# Altium project Sky_1.PrjPcb
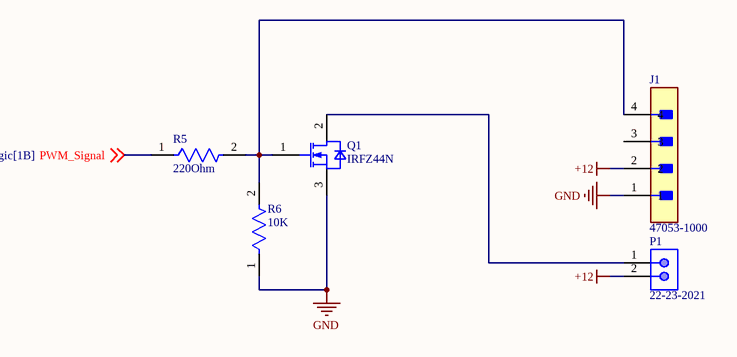
[diagram p0: PWM.SchDoc]
4 sheets, 42 parts. Net scope: flat (ports and power ports of the same name join across sheets).
Board file: PCB1.PcbDoc
Sheets:
  PWM.SchDoc
  Power.SchDoc
  Logic.SchDoc
  Ports_and_pins.SchDoc

## Sheet PWM.SchDoc
size A4; SheetNumber: 1; SheetTotal: 4

### Parts
J1  47053-1000  [FP-470531000-MFG]
P1  22-23-2021  [MOLX-22-23-2021_V]
Q1  IRFZ44N  [TO220]
R5  220Ohm  [FP-CRGCQ1206-IPC_C]
R6  10K  [FP-CRGCQ1206-IPC_C]

### Nets
+12: J1.2 P1.2
GND: J1.1 Q1.3(SOURCE) R6.1
PWM_Signal: R5.1 ; off-sheet PWM_Signal
NetJ1_4: J1.4 Q1.1(GATE) R5.2 R6.2
NetP1_1: P1.1 Q1.2(DRAIN)

Not connected (* = marked no-connect by the designer): J1 3

### Library data of the parts
J1 = CMP-04776-000290-2: CONN HEADER VERT 4POS 2.54MM; NexarPartId: 854935; Manufacturer Lifecycle Status: ACTIVE; Voltage Rating (DC): 250V; Gender: Male; Plating: Copper; Number of Positions: 4; Glow Wire Compliant: Non-compliant; Current Rating: 500mA; Max Operating Temperature: 75°C; Number of Rows: 1; REACH SVHC: Unknown; Ambient Temperature Range High: 105°C; Pitch: 2.54mm; Height: 7.7mm; Min Operating Temperature: 0°C; Packaging: Bulk; Contact Material: Brass, Copper; Contact Plating: Tin; Lead Pitch: 2.54mm; Voltage Rating: 250V; Termination: Through Hole; Radiation Hardening: No; Orientation: Vertical; Mount: Through Hole; Number of Pins: 4; Country of Origin: HK; Halogen Free: Low Halogen; Lifecycle Status: Production; Number of Circuits: 4; Schedule B: 8536694040, 8536694040; Housing Color: Beige; Housing Material: Nylon; Depth: 5.84mm; RoHS: Compliant; Length: 10.2mm; Number of Contacts: 4
P1 = CMP-1704-00001-3: Male Header, Pitch 2.54 mm, 1 x 2 Position, Height 10.67 mm, Tail Length 3.56 mm, 0 to 75 degC, RoHS, Bulk; Package Quantity: 3000; Height: 10.67 mm; RoHSCompliant: True; ComponentLink2URL: https://datasheet.ciiva.com/19454/232266-19454304.pdf; PartNumber: 22-23-2021; Packaging: Bulk; ComponentLink2Description: Datasheet; Min Operating Temperature: 0 degC; ComponentLink1Description: Manufacturer URL; Length: 5.08 mm; Mounting Technology: Through Hole; Max Operating Temperature: 75 degC; REACH SVHC: Unknown; PackageDescription: Male Header, Pitch 2.54 mm, 1 x 2 Position, Height 10.67 mm, Tail Length 3.56 mm; ComponentLink1URL: http://www.molex.com/; Mount: Through Hole; Radiation Hardening: No; Width: 6.35 mm; Pins: 2
Q1 = IRFZ44N: OptiMOS 3 Power-Transistor, VDS 100V; Manufacturer: Infineon Technologies; Manufacturer Order Number: IRFZ44N; PackageReference: PG-TO220-3-904
R5 R6 = CMP-03211-000249-1: CRGCQ1206 100KΩ 0.25W 1% ±100ppm/°C 200V; Manufacturer: TE Connectivity; Manufacturer Part Number: CRGCQ1206F100K; Tolerance: 0.01; Automotive Grade: Grade 1141; Lead Free: Yes; Power Rating: 0.25W; Resistance: 100KΩ; ComponentLink2Description: Datasheet; Voltage Rating: 200V; Ambient Temperature Range High: +70°C; Device Class L1: Passive Components; Value: 100KΩ; ComponentLink2URL: https://www.te.com/commerce/DocumentDelivery/DDEController?Action=showdoc&DocId=Data+Sheet%7F1773204-3%7F1%7Fpdf%7FEnglish%7FENG_DS_1773204-3_1.pdf%7F4-2176347-1150; Temperature Range High: +155°C; Category: Res; RoHS: TRUE; Temperature: -55°C to +155°C; Series: CRGCQ; Package: CRGCQ1206; Device Class L3: Chip SMD Resistors; Height: 0.65mm; Automotive: Yes; Temperature Coefficient: ±100ppm/°C; Temperature Range Low: -55°C; Ipc Land Pattern Name: RESC310155X55; Device Class L2: Resistors; Octopart: https://octopart.com/crgcq1206f100k-te+connectivity-91018242; Composition: Thick Film

## Sheet Power.SchDoc
size A4; SheetNumber: 2; SheetTotal: 4
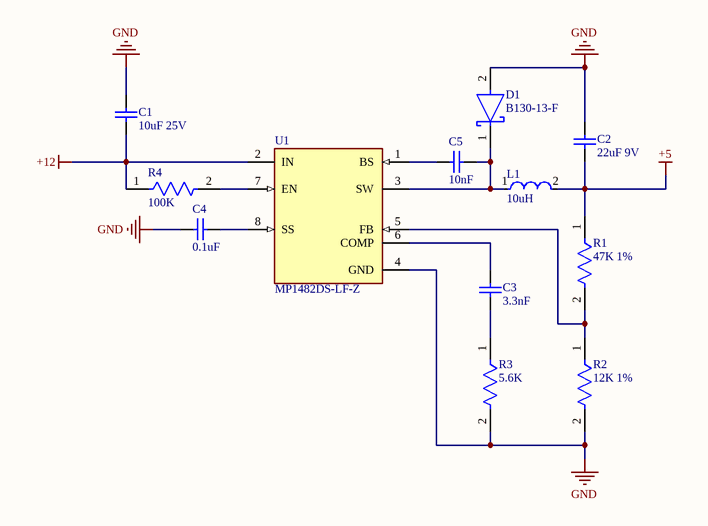
[diagram p1: Power.SchDoc]

### Parts
C1  10uF 25V  [CAPC1206(3216)100_L]
C2  22uF 9V  [CAPC1206(3216)100_L]
C3  3.3nF  [CAPC1206(3216)100_L]
C4  0.1uF  [CAPC1206(3216)100_L]
C5  10nF  [CAPC1206(3216)100_L]
D1  B130-13-F  [FP-SMA-MFG]
L1  10uH  [FP-IHLP-3232DZ-FP_2_413x5-MFG]
R1  47K 1%  [FP-CRGCQ1206-IPC_C]
R2  12K 1%  [FP-CRGCQ1206-IPC_C]
R3  5.6K  [FP-CRGCQ1206-IPC_C]
R4  100K  [FP-CRGCQ1206-IPC_C]
U1  MP1482DS-LF-Z  [FP-MP1482DS-LF-Z-MFG]

### Nets
+5: C2.1 L1.2 R1.1
+12: C1.1 R4.1 U1.2(IN)
GND: C1.2 C2.2 C4.2 D1.2(A) R2.2 R3.2 U1.4(GND)
NetC3_1: C3.1 R3.1
NetC3_2: C3.2 U1.6(COMP)
NetC4_1: C4.1 U1.8(SS)
NetC5_1: C5.1 D1.1(C) L1.1 U1.3(SW)
NetC5_2: C5.2 U1.1(BS)
NetR1_2: R1.2 R2.1 U1.5(FB)
NetR4_2: R4.2 U1.7(EN)

### Library data of the parts
C1-C5 = CMP-1037-03755-1: CAP 22nF 25V ±10% 1206 (3216 Metric) Thickness 1mm SMD; Tolerance: Â±10%; Case-Metric: 3216; Case-EIA: 1206; Value: 22nF; Max Thickness: 1 mm; Rated Voltage: 25 V; Technology: SMT
D1 = CMP-2000-05883-2: DIODE SCHOTTKY 30V 1A SMA; Max Forward Surge Current (Ifsm): 30A; Forward Voltage: 500mV; Polarity: Standard; Capacitance: 110pF; Element Configuration: Single; Peak Reverse Current: 500uA; Mount: Surface Mount; REACH SVHC: No SVHC; Output Current: 1A; Termination: SMD/SMT; Max Operating Temperature: 150°C; Height: 2.1mm; Voltage Rating (DC): 30V; Forward Current: 1A; Length: 4.6mm; Width: 2.92mm; Min Operating Temperature: -65°C; Number of Pins: 2; Current Rating: 1A; Packaging: Tape and Reel; Max Reverse Voltage (DC): 30V; Case/Package: SMA; Lead Free: Lead Free; Average Rectified Current: 1A; Radiation Hardening: No; Max Repetitive Reverse Voltage (Vrrm): 30V; Peak Non-Repetitive Surge Current: 30A; Weight: 0.002258oz; Package Quantity: 5000
L1 = CMP-02424-000031-1: Automotive Inductors, Low DCR Series 10uH 5.4A 51.8mΩ 20%
R1-R4 = CMP-03211-000249-1: as R5 on sheet PWM; Automotive Grade: Grade 1141; Lead Free: Yes; Power Rating: 0.25W; Resistance: 100KΩ; ComponentLink2Description: Datasheet; Voltage Rating: 200V; Ambient Temperature Range High: +70°C; Device Class L1: Passive Components; Value: 100KΩ; ComponentLink2URL: https://www.te.com/commerce/DocumentDelivery/DDEController?Action=showdoc&DocId=Data+Sheet%7F1773204-3%7F1%7Fpdf%7FEnglish%7FENG_DS_1773204-3_1.pdf%7F4-2176347-1150; Temperature Range High: +155°C; Category: Res; RoHS: TRUE; Temperature: -55°C to +155°C; Series: CRGCQ; Package: CRGCQ1206; Device Class L3: Chip SMD Resistors; Height: 0.65mm; Automotive: Yes; Temperature Coefficient: ±100ppm/°C; Temperature Range Low: -55°C; Ipc Land Pattern Name: RESC310155X55; Device Class L2: Resistors; Octopart: https://octopart.com/crgcq1206f100k-te+connectivity-91018242; Composition: Thick Film
U1 = CMP-57379-000001-1: IC REG BUCK ADJUSTABLE 2A 8SOIC; Manufacturer: Monolithic Power Systems; Max Duty Cycle: 90%; Switching Frequency: 340kHz; Standoff Height: 0.1mm; Max Power Dissipation: 1.38W; Output Type: AdjustableProgrammable; Output Voltage: 0.923-15V; Nominal Supply Current: 1.3mA; Max Supply Voltage: 18V; Max Junction Temp: +125°C; Description: Buck Switching Regulator IC Positive Adjustable 0.923V 1 Output 2A 8-SOIC (0.154", 3.90mm Width); Number Of Outputs: 1; Min Supply Voltage: 4.75V; Switching Topology: Buck; Ambient Temperature Range High: +85°C; Temperature: -40°C to +125°C; Device Class L2: Power Management ICs; Mouser Description: MP1482 Series 18 V 2 A SMT Synchronous Rectified Step-Down Converter-SOIC-8; Device Class L3: Voltage Regulators - Switching; Ipc Land Pattern Name: SOIC127P600X155-8; Automotive: No; Octopart: https://octopart.com/mp1482ds-lf-z-monolithic+power+systems-17392490; ComponentLink2Description: Datasheet; RoHS: TRUE; Height: 1.75mm; Digikey Description: IC REG BUCK ADJUSTABLE 2A 8SOIC; Lead Free: Yes; Device Class L1: Integrated Circuits (ICs); Temperature Range Low: -40°C; Category: IC; Manufacturer Part Number: MP1482DS-LF-Z; Package: 0; Output Current: 2A; ComponentLink2URL: https://www.monolithicpower.com/en/documentview/productdocument/index/version/2/document_type/Datasheet/lang/en/sku/MP1482/document_id/344/; Temperature Range High: +125°C; Ambient Temperature Range Low: -40°C

## Sheet Logic.SchDoc
size A4; SheetNumber: 3; SheetTotal: 4
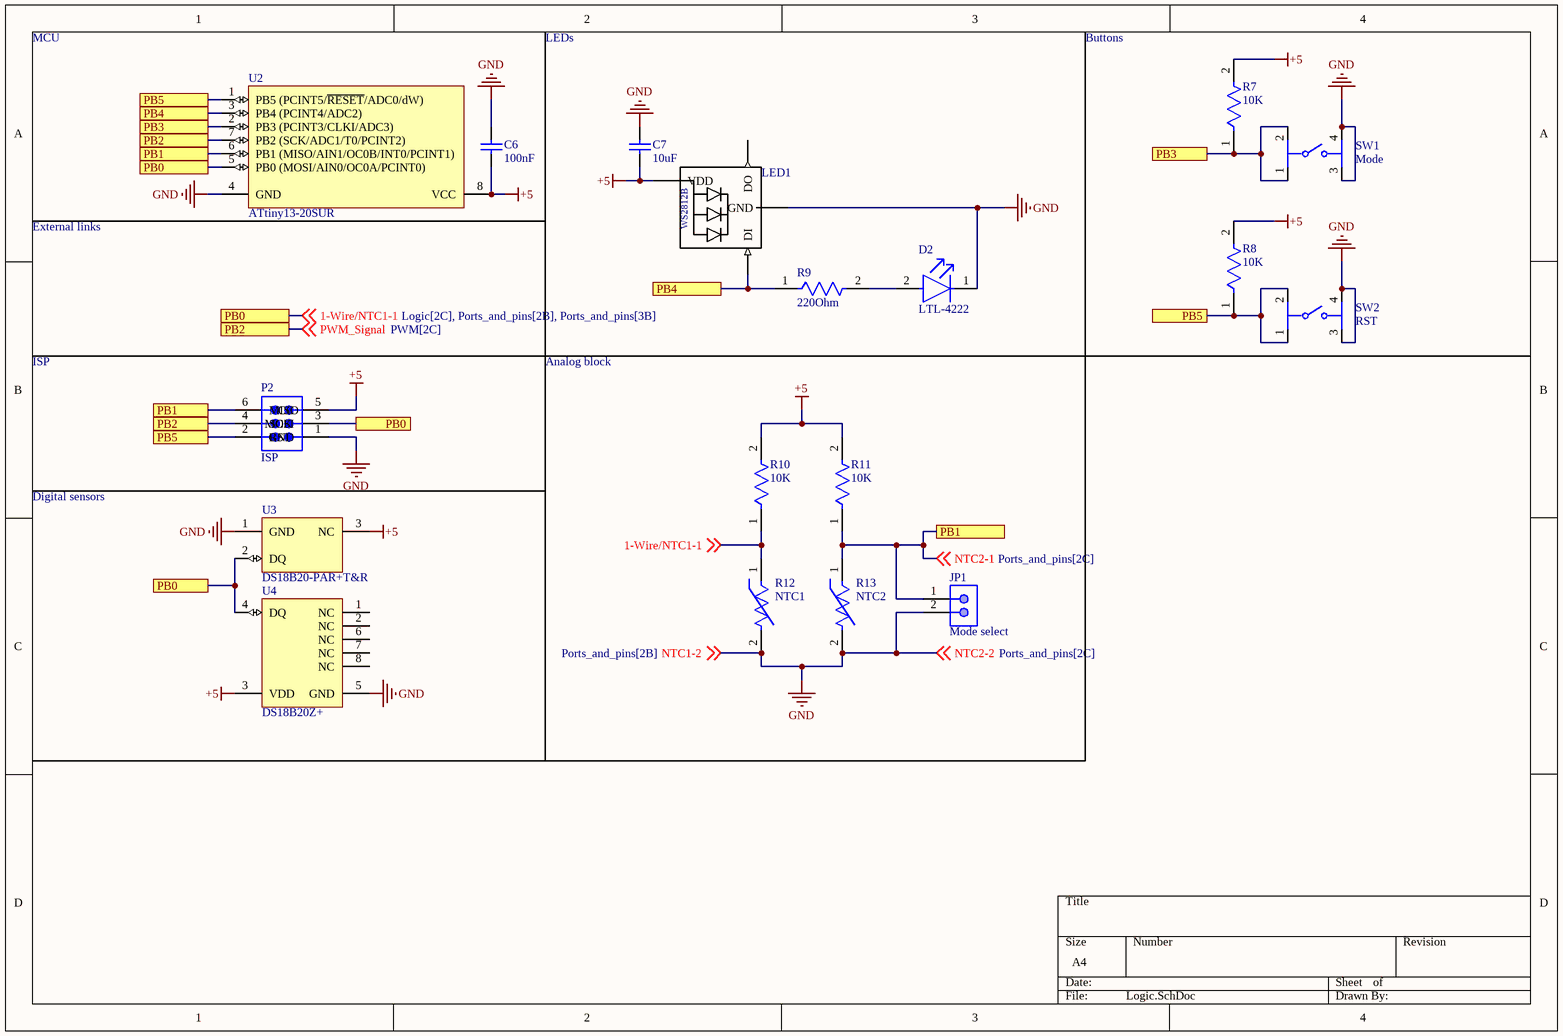
[diagram p2: Logic.SchDoc]

### Parts
C6  100nF  [CAPC1206(3216)100_L]
C7  10uF  [CAPC1206(3216)100_L]
D2  LTL-4222  [FP-LTL-4222-MFG]
JP1  Mode select  [AMPH-68000-102HLF_V]
LED1  WS2812B  [*WS2812B_WS2812B(Primary)]  (value not drawn)
P2  ISP  [SMTC-MTSW-103-07-X-D-244]
R7  10K  [FP-CRGCQ1206-IPC_C]
R8  10K  [FP-CRGCQ1206-IPC_C]
R9  220Ohm  [FP-CRGCQ1206-IPC_C]
R10  10K  [FP-CRGCQ1206-IPC_C]
R11  10K  [FP-CRGCQ1206-IPC_C]
R12  NTC1  [FP-NCU18-0_15-IPC_C]
R13  NTC2  [FP-NCU18-0_15-IPC_C]
SW1  Mode  [FP-TL1105AF160Q-MFG]
SW2  RST  [FP-TL1105AF160Q-MFG]
U2  ATtiny13-20SUR  [8S2_M]
U3  DS18B20-PAR+T&R  [Q3+4]
U4  DS18B20Z+  [MAXM-S8+2_L]

### Ports
PB0 (see Logic[1A], Logic[1B]), PB0 (see Logic[1A], Logic[1B], Logic[1C]), PB0 (see Logic[1B], Logic[1C]), PB1 (see Logic[1A], Logic[1B]), PB1 (see Logic[1A], Logic[3C]), PB1 (see Logic[1B], Logic[3C]), PB2 (see Logic[1A], Logic[1B]), PB2 (see Logic[1B]), PB3 (see Logic[1A]), PB3 (see Logic[3A]), PB4 (see Logic[1A]), PB4 (see Logic[2B]), PB5 (see Logic[1A], Logic[1B]), PB5 (see Logic[1A], Logic[3B]), PB5 (see Logic[1B], Logic[3B])

### Nets
+5: C6.1 C7.1 LED1.1-VDD(VDD) P2.5(VCC) R7.2 R8.2 R10.2 R11.2 U2.8(VCC) U3.3(NC) U4.3(VDD)
GND: C6.2 C7.2 D2.1(C) JP1.2 LED1.3-GND(GND) P2.1(GND) R12.2 R13.2 SW1.3 SW1.4 SW2.3 SW2.4 U2.4(GND) U3.1(GND) U4.5(GND) ; off-sheet NTC2-2, off-sheet NTC1-2  [also labelled NTC1-2, NTC2-2]
1-Wire/NTC1-1: P2.3(MOSI) R10.1 R12.1 U2.5(PB0_(MOSI/AIN0/OC0A/PCINT0)) U3.2(DQ) U4.4(DQ) ; off-sheet 1-Wire/NTC1-1, port PB0
NTC2-1: JP1.1 P2.6(MISO) R11.1 R13.1 U2.6(PB1_(MISO/AIN1/OC0B/INT0/PCINT1)) ; off-sheet NTC2-1, port PB1
PWM_Signal: P2.4(SCK) U2.7(PB2_(SCK/ADC1/T0/PCINT2)) ; off-sheet PWM_Signal, port PB2
NetD2_2: D2.2(A) R9.2
NetLED1_4-DIN: LED1.4-DIN(DI) R9.1 U2.3(PB4_(PCINT4/ADC2)) ; port PB4
NetP2_2: P2.2(RST) R8.1 SW2.1 SW2.2 U2.1(PB5_(PCINT5/~{RESET}/ADC0/dW)) ; port PB5
NetR7_1: R7.1 SW1.1 SW1.2 U2.2(PB3_(PCINT3/CLKI/ADC3)) ; port PB3

Not connected (* = marked no-connect by the designer): LED1 2-DOUT(DO); U4 1(NC) 2(NC) 6(NC) 7(NC) 8(NC)

### Notes on the sheet
- MCU
- LEDs
- Buttons
- External links
- ISP
- Analog block
- Digital sensors

### Library data of the parts
C6 C7 = CMP-1037-03755-1: as C1 on sheet Power; Value: 22nF; Max Thickness: 1 mm; Rated Voltage: 25 V; Technology: SMT
D2 = CMP-22017-000043-1: LED RED CLEAR T-1 T/H; Number of Elements: 1; Reverse Voltage: 5V; Lens Style: Dome; Power Dissipation: 100mW; Viewing Angle: 20°; Dominant Wavelength: 623nm; Wavelength: 635nm; Test Current: 10mA; Luminous Intensity: 29mcd; Forward Current: 20mA; Forward Voltage: 2V; Height: 6.55mm; Color: Red; Illumination Color: Red; Series: -; Packaging: Bulk; Case/Package: T; Mount: Through Hole; Length: 4mm; RoHS Compliant: Yes; Min Operating Temperature: -55°C; Lens Transparency: Clear; Max Operating Temperature: 100°C; Number of Pins: 2; Package Quantity: 1000; Number of LEDs: 1; Depth: 4mm; Lens Color: Red; Radiation Hardening: No
JP1 = CMP-2000-05666-1: Male Header, Pitch 2.54 mm, 1 x 2 Position, Height 8.38 mm, Tail Length 2.41 mm, RoHS, Bulk; Number of Positions: 2; Insulation Resistance: 5000MOhms; Voltage Rating: 1.5kV; Mounting Angle: Vertical; Pitch: 2.54mm; Brand: FCI; Current Rating: 3A; Mating Post Length: 5.84mm; Operating Temperature Range: -65Cto+125C; Product Category: Headers&WireHousings; Datasheet URL: https://datasheet.ciiva.com/5149/68000-274228-5149165.pdf; Number of Positions / Contacts: 2; Contact Gender: Pin(Male); Packaging: Bulk; Mounting Technology: ThroughHole; Product Type: Headers; Housing Material: Thermoplastic; Contact Material: PhosphorBronze; Contact Plating: Gold/GTX; Package Description: Male Header, Pitch 2.54 mm, 1 x 2 Position, Height 8.38 mm, Tail Length 2.41 mm; Package Reference: 68000-102HLF; Type: Unshrouded; Factory Pack Quantity: 100; Termination Style: ThroughHole; RoHS: Details; Series: 68000; Mounting Style: ThroughHole; Flammability Rating: UL94V-0; Number of Rows: 1; Manufacturer: FCI; Termination Post Length: 2.41mm; Manufacturer URL: http://www.amphenol.com/; Datasheet Version: Rev. F, 04/2006
LED1 = WS2812B: Intelligent control LED integrated light source; MF: Worldsemi; SnapEDA_Link: https://www.snapeda.com/parts/WS2812B/Worldsemi/view-part/?ref=snap; Package: None; MP: WS2812B; Check_prices: https://www.snapeda.com/parts/WS2812B/Worldsemi/view-part/?ref=eda; Value: *
P2 = CMP-1024-00098-1: Modified .025" SQ Post Header, Through-hole, Vertical, -55 to 125 degC, 2.54 mm Pitch, 6-Pin, Male, RoHS; Manufacturer: Samtec; PartNumber: MTSW-103-07-F-D-244; Pitch: 2.54 mm; DatasheetVersion: F-214; Orientation: Vertical; PackageDescription: Assembly .025" [.64] SQ Post Terminal Strip; ComponentLink1Description: Manufacturer URL; ComponentLink3Description: Package Specification; PackageVersion: BI, 2/1987; ComponentLink1URL: http://www.samtec.com; PackageReference: MTSW-103-07-X-D-244; ComponentLink3URL: http://www.samtec.com/documents/webfiles/cpdf/MTSW-XXX-XX-X-X-XXXX-XX-XXX-MKT1.pdf; Temperature Range: -55 to 125 degC; Mounting Technology: Through-hole; RoHS: True; ComponentLink2URL: http://www.samtec.com/documents/webfiles/pdf/MTSW.PDF; ComponentLink2Description: Datasheet
R7-R11 = CMP-03211-000249-1: as R5 on sheet PWM; Automotive Grade: Grade 1141; Lead Free: Yes; Power Rating: 0.25W; Resistance: 100KΩ; ComponentLink2Description: Datasheet; Voltage Rating: 200V; Ambient Temperature Range High: +70°C; Device Class L1: Passive Components; Value: 100KΩ; ComponentLink2URL: https://www.te.com/commerce/DocumentDelivery/DDEController?Action=showdoc&DocId=Data+Sheet%7F1773204-3%7F1%7Fpdf%7FEnglish%7FENG_DS_1773204-3_1.pdf%7F4-2176347-1150; Temperature Range High: +155°C; Category: Res; RoHS: TRUE; Temperature: -55°C to +155°C; Series: CRGCQ; Package: CRGCQ1206; Device Class L3: Chip SMD Resistors; Height: 0.65mm; Automotive: Yes; Temperature Coefficient: ±100ppm/°C; Temperature Range Low: -55°C; Ipc Land Pattern Name: RESC310155X55; Device Class L2: Resistors; Octopart: https://octopart.com/crgcq1206f100k-te+connectivity-91018242; Composition: Thick Film
R12 R13 = CMP-06022-000229-2: THERMISTOR NTC
SW1 SW2 = CMP-17879-000016-1: SWITCH TACTILE SPST-NO 0.05A 12V; Mechanical Life: 100000Cycles; Contact Current Rating: 50mA; Contact Resistance: 100mR; Switch Function: Off-Mom; Actuator Type: Standard; Actuator Length: 1.4mm; Max Voltage Rating (DC): 50V; Throw Configuration: SPST; Actuator Material: Nylon; Illumination Type: Non-Illuminated; Switch Travel: 0.25mm; Operating Force: 160gf; Package Quantity: 750; Width: 6mm; Series: TL1105; Voltage Rating (DC): 12V; Length: 6mm; Contact Plating: Silver; Color: Black; Housing Material: Nylon; Min Operating Temperature: -20°C; Lead Free: Lead Free; Mount: Through Hole; Termination: PC Pin; RoHS Compliant: Yes; Orientation: Straight; Max Operating Temperature: 70°C; Reach SVHC Compliant: Yes; Packaging: Bulk; Electrical Life: 100000Cycles; Current Rating: 50mA; Contact Material: Bronze; Size: 6mm
U2 = CMP-0093-00337-1: 8-bit AVR Microcontroller, 2.7-5.5V, 1KB Flash, 64 Bytes EEPROM, 64 Bytes SRAM, 8-pin SOIC, Industrial Grade (-40°C to 85°C), Pb-Free, Reel; PackageReference: 8S2; ComponentLink3URL: http://www.atmel.com/dyn/resources/prod_documents/2535S.pdf; ComponentLink2URL: http://www.atmel.com/dyn/resources/prod_documents/doc2535.pdf; PackageDescription: 8-Lead, 0.208" Body, Plastic Small Outline Package (EIAJ); PackageVersion: revF, Apr-2008; ComponentLink3Description: ATtiny13 Summary; DatasheetVersion: revJ, Aug-2010; ComponentLink1URL: http://www.atmel.com/; ComponentLink1Description: Manufacturer URL; ComponentLink2Description: ATtiny13  Datasheet
U3 = CMP-0253-00002-1: High-Precision Parasite-Power Digital Thermometer, 1-Wire Interface, ±0.5°C Accuracy, 3-Pin TO92, -55°C to +125°C, Tape and Reel, Pb-Free; ComponentLink1URL: http://www.maxim-ic.com; PackageDescription: TO-92 Package, Formed Leads, Body Dia. 4.7mm; Leads 0.51 x 0.51 mm (max), Pb-Free; ComponentLink1Description: Manufacturer URL; ComponentLink2URL: http://datasheets.maxim-ic.com/en/ds/DS18B20-PAR.pdf; Code_JEDEC: TO-226-AA; DatasheetVersion: 2007; ComponentLink2Description: Datasheet; PackageReference: Q3+4; PackageVersion: revB, 2010
U4 = CMP-0253-00019-2: High-Precision 1-Wire Digital Thermometer, -55 to 125 degC, 8-Pin SOIC (S8+2), Pb-Free; Sensor Type: Local; Temp. Thresh.: Programmable (NV); Parasite Pwr.: Yes; ComponentLink1Description: Manufacturer URL; PartNumber: DS18B20Z+; Mounting Technology: Surface Mount; ComponentLink2URL: http://datasheets.maximintegrated.com/en/ds/DS18B20.pdf; Code_JEDEC: MS012; ComponentLink2Description: Datasheet; DatasheetVersion: Rev. 4; PackageVersion: Rev. D, 10/2012; ComponentLink1URL: http://www.maximintegrated.com/; PackageReference: S8+2; ComponentLink3URL: http://pdfserv.maximintegrated.com/package_dwgs/21-0041.PDF; Interface: 1-Wire; ComponentLink3Description: Package Specification; RoHS: Pb-Free; Multi Droppable: Yes; Generic Part Number: DS18B20; PackageDescription: 8-Pin Small-Outline IC, Narrow (0.15in) (S8+2), Body 4.90 x 3.90 mm, Pitch 1.27 mm

## Sheet Ports_and_pins.SchDoc
size A4; SheetNumber: 4; SheetTotal: 4
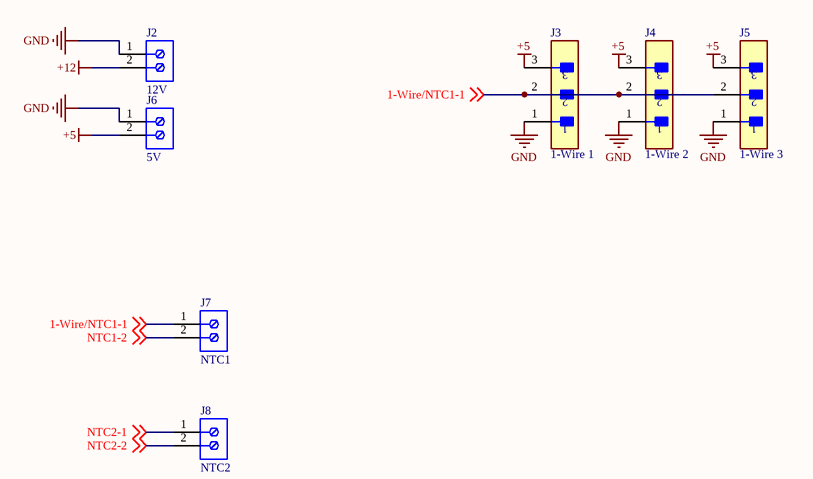
[diagram p3: Ports_and_pins.SchDoc]

### Parts
J2  12V  [691214110002]
J3  1-Wire 1  [FP-MTLW-103-07-G-S-230-MFG]
J4  1-Wire 2  [FP-MTLW-103-07-G-S-230-MFG]
J5  1-Wire 3  [FP-MTLW-103-07-G-S-230-MFG]
J6  5V  [691214110002]
J7  NTC1  [691214110002]
J8  NTC2  [691214110002]

### Nets
+5: J3.3 J4.3 J5.3 J6.2
+12: J2.2
GND: J2.1 J3.1 J4.1 J5.1 J6.1 J7.2 J8.2 ; off-sheet NTC1-2, off-sheet NTC2-2  [also labelled NTC1-2, NTC2-2]
1-Wire/NTC1-1: J3.2 J4.2 J5.2 J7.1 ; off-sheet 1-Wire/NTC1-1
NTC2-1: J8.1 ; off-sheet NTC2-1

### Library data of the parts
J2 J6-J8 = CMP-1502-02464-3: 2141 Series 3.5MM Pitch Straight, Pcb Terminal Block, Through Hole, 2 Way; Plating: Brass, Steel; Wire Gauge (Min): 16AWG; Number of Contacts: 2; Current: 10A; Stripping Length: -6mm; Voltage Rating: 300V; Pitch: 3.5052mm; Wire Gauge (Max): 24AWG; Number of Levels: 1; Lead Pitch: 3.5mm; Width: 7.9mm; Packaging: Box; RoHS: Compliant; Number of Rows: 1; Min Operating Temperature: -40°C; Mount: Through Hole; Number of Pins: 2; Contact Plating: Brass, Tin; Housing Material: Nylon; Current Rating: 10A; Termination: Screw; Color: Blue, Green; Number of Positions Per Level: 2; Height: 8.7mm; Voltage: 300V; Max Operating Temperature: 105°C; Wire/Cable Gauge: 24AWG; Length: 7.4mm; Contact Material: Tin
J3-J5 = CMP-02766-001679-1: CONN HEADER VERT 3POS 2.54MM; Max Current Rating: 3A; Number of Contacts: 3; Gender: Male; Contact Material: Bronze; Pitch: 2.54mm; Housing Material: Polymer; Contact Plating: Gold; Radiation Hardening: No; Depth: 2.48mm; Packaging: Bulk; Number of Rows: 1; Max Operating Temperature: 125°C; Housing Color: Black; Termination: Solder; Min Operating Temperature: -55°C; Length: 7.62mm; RoHS Compliant: Yes; Orientation: Straight

## Nets that join several sheets
+5: Power (C2.1 L1.2 R1.1), Logic (11 pins), Ports_and_pins (J3.3 J4.3 J5.3 J6.2)
+12: PWM (J1.2 P1.2), Power (C1.1 R4.1 U1.2), Ports_and_pins (J2.2)
GND: PWM (J1.1 Q1.3 R6.1), Power (7 pins), Logic (15 pins), Ports_and_pins (7 pins)
1-Wire/NTC1-1: Logic (6 pins), Ports_and_pins (J3.2 J4.2 J5.2 J7.1)
NTC2-1: Logic (5 pins), Ports_and_pins (J8.1)
PWM_Signal: PWM (R5.1), Logic (P2.4 U2.7)